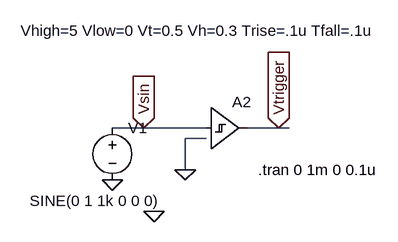
[diagram p0: schematic SCHMITT Trigger.asc]
SCHMITT Trigger.asc, the LTspice schematic file:
Version 4.1
SHEET 1 880 680
WIRE -112 48 -160 48
WIRE -16 48 -112 48
WIRE 96 48 48 48
WIRE 112 48 96 48
WIRE -16 64 -48 64
WIRE -48 112 -48 64
FLAG -160 128 0
FLAG -96 176 0
FLAG -112 48 Vsin
IOPIN -112 48 In
FLAG 96 48 Vtrigger
IOPIN 96 48 In
FLAG -48 112 0
SYMBOL voltage -160 32 R0
WINDOW 3 -127 128 Left 2
WINDOW 123 0 0 Left 0
WINDOW 39 0 0 Left 0
SYMATTR Value SINE(0 1 1k 0 0 0)
SYMATTR InstName V1
SYMBOL Digital\\schmtbuf -16 -16 R0
WINDOW 3 -285 -86 Left 2
SYMATTR Value Vhigh=5 Vlow=0 Vt=0.5 Vh=0.3 Trise=.1u Tfall=.1u
SYMATTR InstName A2
TEXT 64 112 Left 2 !.tran 0 1m 0 0.1u

The netlist it stands for:
* SCHMITT Trigger.asc
V1 Vsin 0 SINE(0 1 1k 0 0 0)
A2 Vsin 0 0 0 0 0 Vtrigger 0 SCHMITT Vhigh=5 Vlow=0 Vt=0.5 Vh=0.3 Trise=.1u Tfall=.1u
.tran 0 1m 0 0.1u
.backanno
.end